# Altium schematic sheet Motor_Connector_Sheet.SchDoc
size A; DocumentNumber: 5; SheetNumber: 5; SheetTotal: 7
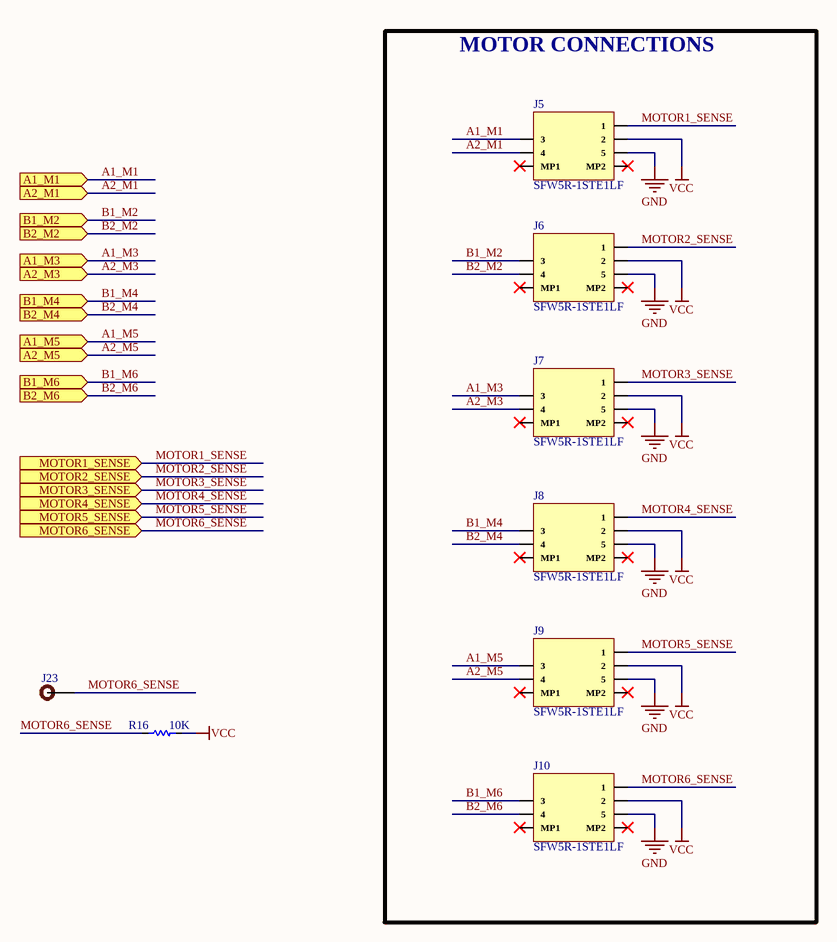
[diagram p0: Motor_Connector_Sheet.SchDoc]

## Parts
J5  SFW5R-1STE1LF  [SFW5R-1STE1LF]
J6  SFW5R-1STE1LF  [SFW5R-1STE1LF]
J7  SFW5R-1STE1LF  [SFW5R-1STE1LF]
J8  SFW5R-1STE1LF  [SFW5R-1STE1LF]
J9  SFW5R-1STE1LF  [SFW5R-1STE1LF]
J10  SFW5R-1STE1LF  [SFW5R-1STE1LF]
J23  Test Point -TH 1.8mm Hole size 0.92mm  [Test Point -TH 1.8mm Hole size 0.92mm]  (value not drawn)  (no BOM)
R16  10K  [Res-0402]

## Blocks framed on the sheet
MOTOR CONNECTIONS: J5-J10

## Ports
A1_M1 (in), A1_M3 (in), A1_M5 (in), A2_M1 (in), A2_M3 (in), A2_M5 (in), B1_M2 (in), B1_M4 (in), B1_M6 (in), B2_M2 (in), B2_M4 (in), B2_M6 (in), MOTOR1_SENSE (in), MOTOR2_SENSE (in), MOTOR3_SENSE (in), MOTOR4_SENSE (in), MOTOR5_SENSE (in), MOTOR6_SENSE (in)

## Nets
GND: J5.5 J6.5 J7.5 J8.5 J9.5 J10.5
VCC: J5.2 J6.2 J7.2 J8.2 J9.2 J10.2 R16.2
A1_M1: J5.3 ; port A1_M1
A1_M3: J7.3 ; port A1_M3
A1_M5: J9.3 ; port A1_M5
A2_M1: J5.4 ; port A2_M1
A2_M3: J7.4 ; port A2_M3
A2_M5: J9.4 ; port A2_M5
B1_M2: J6.3 ; port B1_M2
B1_M4: J8.3 ; port B1_M4
B1_M6: J10.3 ; port B1_M6
B2_M2: J6.4 ; port B2_M2
B2_M4: J8.4 ; port B2_M4
B2_M6: J10.4 ; port B2_M6
MOTOR1_SENSE: J5.1 ; port MOTOR1_SENSE
MOTOR2_SENSE: J6.1 ; port MOTOR2_SENSE
MOTOR3_SENSE: J7.1 ; port MOTOR3_SENSE
MOTOR4_SENSE: J8.1 ; port MOTOR4_SENSE
MOTOR5_SENSE: J9.1 ; port MOTOR5_SENSE
MOTOR6_SENSE: J10.1 J23.1 R16.1 ; port MOTOR6_SENSE

Not connected (* = marked no-connect by the designer): J5 MP1* MP2*; J6 MP1* MP2*; J7 MP1* MP2*; J8 MP1* MP2*; J9 MP1* MP2*; J10 MP1* MP2*

## Library data of the parts
J5-J10 = SFW5R-1STE1LF: CONN FFC FPC BOTTOM 5POS 1MM R/A; Manufacturer: Amphenol ICC / FCI; Item Type: FFC / FPC; Supplier: Avnet; Supplier Part Number: 62K5638; Manufacturer Part Number: SFW5R-1STE1LF; RoHS: Yes; Stock: 33; Pricing: 1=0.257 (USD); ComponentLink1URL: https://datasheet.ciiva.com/5137/sfw12lf-5137830.pdf?src-supplier=Mouser; ComponentLink1Description: https://datasheet.ciiva.com/5137/sfw12lf-5137830.pdf?src-supplier=Mouser; ComponentLink2URL: https://datasheet.ciiva.com/8038/sfw12lf-8038169.pdf?src-supplier=Element14; ComponentLink2Description: https://datasheet.ciiva.com/8038/sfw12lf-8038169.pdf?src-supplier=Element14; ComponentLink3URL: https://datasheet.ciiva.com/10369/sfw12lf-10369098.pdf?src-supplier=Avnet; ComponentLink3Description: https://datasheet.ciiva.com/10369/sfw12lf-10369098.pdf?src-supplier=Avnet; ComponentLink4URL: https://datasheet.ciiva.com/670/sfw12lf-670021.pdf?src-supplier=Digikey; ComponentLink4Description: https://datasheet.ciiva.com/670/sfw12lf-670021.pdf?src-supplier=Digikey; ComponentLink5URL: https://datasheet.ciiva.com/670/sfw12lf-670022.pdf?src-supplier=Digikey; ComponentLink5Description: https://datasheet.ciiva.com/670/sfw12lf-670022.pdf?src-supplier=Digikey; ComponentLink6URL: https://datasheet.ciiva.com/670/sfw12lf-670023.pdf?src-supplier=Digikey; ComponentLink6Description: https://datasheet.ciiva.com/670/sfw12lf-670023.pdf?src-supplier=Digikey
R16 = RC0402FR-0710KL: RES 10K OHM 1% 1/16W 0402; Manufacturer: Yageo; Resistance: 10kR; Voltage Rating (DC): 50V; Temperature Coefficient: 100ppm/°C; Power Rating: 62.5mW; Max Power Dissipation: 63mW; Item Type: Resistor; Supplier 1: Mouser; Manufacturer Part Number: RC0402FR-0710KL; RoHS: Yes; Category: Chip SMD Resistors; Stock 1: 18648329; Pricing 1: 1=0.10000, 10=0.01400, 50=0.01400, 100=0.00500, 1000=0.00300, 10000=0.00200 (USD); Case/Package: 0402; Number of Pins: 2; Case Code (Imperial): 0402; Case Code (Metric): 1005; Min Operating Temperature: -55°C; Max Operating Temperature: 155°C; Resistor Type: Thick Film; Tolerance: 1%; Packaging: Tape and Reel; Voltage Rating: 50V; Termination: SMD/SMT; Working Voltage: 50V; Number of Terminations: 2; Features: Moisture Resistant; Series: RC; Resistance Tolerance: 1%; Construction: Rectangular; Length: 1mm; Width: 0.5mm; Height: 0.32mm; Depth: 0.5mm; Lead Pitch: 0.2mm; REACH SVHC: No SVHC; Lead Free: Lead Free; RoHS Compliant: Yes; Military Standard: Not; ComponentLink1URL: https://datasheet.ciiva.com/7660/38568-7660787.pdf?src-supplier=Element14; ComponentLink1Description: https://datasheet.ciiva.com/7660/38568-7660787.pdf?src-supplier=Element14; ComponentLink2URL: https://datasheet.ciiva.com/7849/1686128-7849814.pdf?src-supplier=Element14; ComponentLink2Description: https://datasheet.ciiva.com/7849/1686128-7849814.pdf?src-supplier=Element14; ComponentLink3URL: https://datasheet.ciiva.com/7983/1018594-7983486.pdf?src-supplier=Element14; ComponentLink3Description: https://datasheet.ciiva.com/7983/1018594-7983486.pdf?src-supplier=Element14; ComponentLink4URL: https://datasheet.ciiva.com/22747/1018594-22747512.pdf?src-supplier=Element14; ComponentLink4Description: https://datasheet.ciiva.com/22747/1018594-22747512.pdf?src-supplier=Element14; ComponentLink5URL: https://datasheet.ciiva.com/12667/pyu-rc0402-51-rohs-l-6-r-12667067.pdf?src-supplier=Mouser; ComponentLink5Description: https://datasheet.ciiva.com/12667/pyu-rc0402-51-rohs-l-6-r-12667067.pdf?src-supplier=Mouser; ComponentLink6URL: https://datasheet.ciiva.com/7849/1784430-7849813.pdf?src-supplier=Element14; ComponentLink6Description: https://datasheet.ciiva.com/7849/1784430-7849813.pdf?src-supplier=Element14; ComponentLink7URL: https://datasheet.ciiva.com/7849/1784430-7849815.pdf?src-supplier=Element14; ComponentLink7Description: https://datasheet.ciiva.com/7849/1784430-7849815.pdf?src-supplier=Element14; Supplier Part Number 1: 603-RC0402FR-0710KL; LCSC Part Number: C60490